# EAGLE design pcb_kamex_fuentes_5v_7amp (EAGLE 7.6.0)
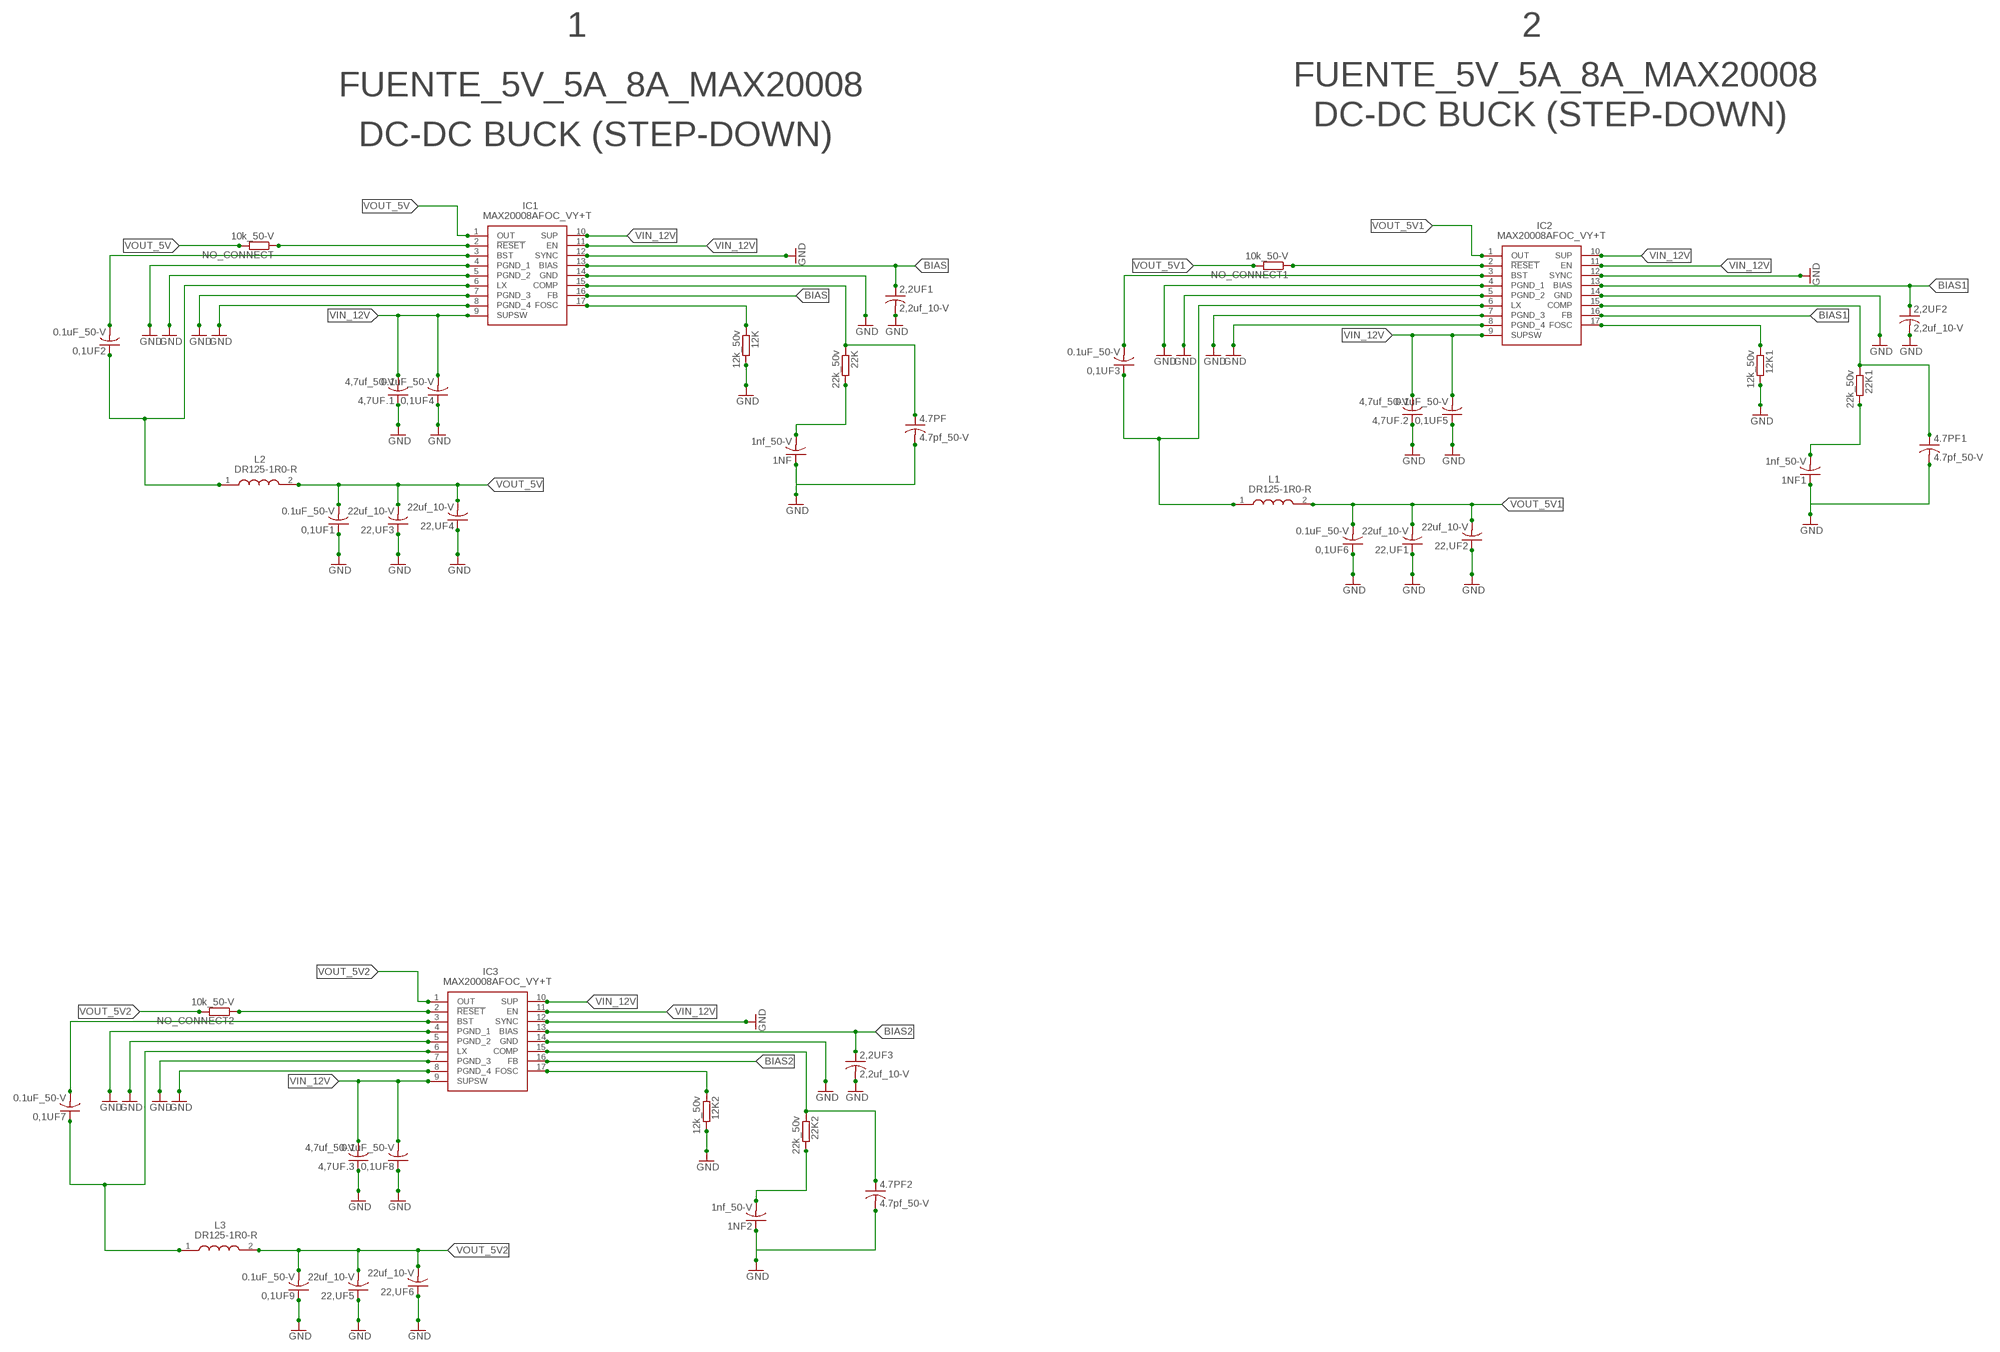
[diagram p0: schematic, sheet 1]

## Parts
0,1UF1  0.1uF_50-V  C-USC0805  [C0805]
0,1UF2  0.1uF_50-V  C-USC0805  [C0805]
0,1UF3  0.1uF_50-V  C-USC0805  [C0805]
0,1UF4  0.1uF_50-V  C-USC0805  [C0805]
0,1UF5  0.1uF_50-V  C-USC0805  [C0805]
0,1UF6  0.1uF_50-V  C-USC0805  [C0805]
0,1UF7  0.1uF_50-V  C-USC0805  [C0805]
0,1UF8  0.1uF_50-V  C-USC0805  [C0805]
0,1UF9  0.1uF_50-V  C-USC0805  [C0805]
1NF  1nf_50-V  C-USC0805  [C0805]
1NF1  1nf_50-V  C-USC0805  [C0805]
1NF2  1nf_50-V  C-USC0805  [C0805]
2,2UF1  2,2uf_10-V  C-USC0805  [C0805]
2,2UF2  2,2uf_10-V  C-USC0805  [C0805]
2,2UF3  2,2uf_10-V  C-USC0805  [C0805]
4,7UF.1  4,7uf_50-V  C-USC0805  [C0805]
4,7UF.2  4,7uf_50-V  C-USC0805  [C0805]
4,7UF.3  4,7uf_50-V  C-USC0805  [C0805]
4.7PF  4.7pf_50-V  C-USC0805  [C0805]
4.7PF1  4.7pf_50-V  C-USC0805  [C0805]
4.7PF2  4.7pf_50-V  C-USC0805  [C0805]
12K  12k_50v  R-EU_M0805  [M0805]
12K1  12k_50v  R-EU_M0805  [M0805]
12K2  12k_50v  R-EU_M0805  [M0805]
22,UF1  22uf_10-V  C-USC0805  [C0805]
22,UF2  22uf_10-V  C-USC0805  [C0805]
22,UF3  22uf_10-V  C-USC0805  [C0805]
22,UF4  22uf_10-V  C-USC0805  [C0805]
22,UF5  22uf_10-V  C-USC0805  [C0805]
22,UF6  22uf_10-V  C-USC0805  [C0805]
22K  22k_50v  R-EU_M0805  [M0805]
22K1  22k_50v  R-EU_M0805  [M0805]
22K2  22k_50v  R-EU_M0805  [M0805]
IC1  MAX20008AFOC_VY+T  [MAX20008AFOCVYT]
IC2  MAX20008AFOC_VY+T  [MAX20008AFOCVYT]
IC3  MAX20008AFOC_VY+T  [MAX20008AFOCVYT]
L1  DR125-1R0-R  [INDPM125125X600N]
L2  DR125-1R0-R  [INDPM125125X600N]
L3  DR125-1R0-R  [INDPM125125X600N]
NO_CONNECT  10k_50-V  R-EU_M0805  [M0805]
NO_CONNECT1  10k_50-V  R-EU_M0805  [M0805]
NO_CONNECT2  10k_50-V  R-EU_M0805  [M0805]

## Nets
BIAS: 2,2UF1.1 IC1.13(BIAS) IC1.16(FB)
BIAS1: 2,2UF2.1 IC2.13(BIAS) IC2.16(FB)
BIAS2: 2,2UF3.1 IC3.13(BIAS) IC3.16(FB)
BST: 0,1UF2.2 IC1.3(BST)
BST1: 0,1UF3.2 IC2.3(BST)
BST2: 0,1UF7.2 IC3.3(BST)
COM: 4.7PF.1 22K.1 IC1.15(COMP)
COM1: 4.7PF1.1 22K1.1 IC2.15(COMP)
COM2: 4.7PF2.1 22K2.1 IC3.15(COMP)
GND [power]: 0,1UF1.1 0,1UF4.1 0,1UF5.1 0,1UF6.1 0,1UF8.1 0,1UF9.1 1NF1.1 1NF2.1 1NF.1 2,2UF1.2 2,2UF2.2 2,2UF3.2 4,7UF.1.1 4,7UF.2.1 4,7UF.3.1 4.7PF1.2 4.7PF2.2 4.7PF.2 12K1.2 12K2.2 12K.2 22,UF1.1 22,UF2.1 22,UF3.1 22,UF4.1 22,UF5.1 22,UF6.1 IC1.4(PGND_1) IC1.5(PGND_2) IC1.7(PGND_3) IC1.8(PGND_4) IC1.12(SYNC) IC1.14(GND) IC2.4(PGND_1) IC2.5(PGND_2) IC2.7(PGND_3) IC2.8(PGND_4) IC2.12(SYNC) IC2.14(GND) IC3.4(PGND_1) IC3.5(PGND_2) IC3.7(PGND_3) IC3.8(PGND_4) IC3.12(SYNC) IC3.14(GND)
N$1: 12K1.1 IC2.17(FOSC)
N$2: 1NF.2 22K.2
N$4: 0,1UF3.1 IC2.6(LX) L1.1
N$5: IC2.2(!RESET) NO_CONNECT1.1
N$6: 1NF1.2 22K1.2
N$7: 12K.1 IC1.17(FOSC)
N$9: 12K2.1 IC3.17(FOSC)
N$10: 0,1UF7.1 IC3.6(LX) L3.1
N$11: 0,1UF2.1 IC1.6(LX) L2.1
N$12: IC1.2(!RESET) NO_CONNECT.1
N$13: IC3.2(!RESET) NO_CONNECT2.1
N$14: 1NF2.2 22K2.2
VIN_12V [power]: 0,1UF4.2 0,1UF5.2 0,1UF8.2 4,7UF.1.2 4,7UF.2.2 4,7UF.3.2 IC1.9(SUPSW) IC1.10(SUP) IC1.11(EN) IC2.9(SUPSW) IC2.10(SUP) IC2.11(EN) IC3.9(SUPSW) IC3.10(SUP) IC3.11(EN)
VOUT_5V: 0,1UF1.2 22,UF3.2 22,UF4.2 IC1.1(OUT) L2.2 NO_CONNECT.2
VOUT_5V1: 0,1UF6.2 22,UF1.2 22,UF2.2 IC2.1(OUT) L1.2 NO_CONNECT1.2
VOUT_5V2: 0,1UF9.2 22,UF5.2 22,UF6.2 IC3.1(OUT) L3.2 NO_CONNECT2.2

## Notes on the sheet
- 1 | 2
- FUENTE_5V_5A_8A_MAX20008 | FUENTE_5V_5A_8A_MAX20008
- DC-DC BUCK (STEP-DOWN)
- DC-DC BUCK (STEP-DOWN)

## Library data of the parts
0,1UF1-0,1UF9 1NF 1NF1 1NF2 2,2UF1-2,2UF3 4,7UF.1-4,7UF.3 4.7PF 4.7PF1 4.7PF2 22,UF1-22,UF6 = rcl:C-US: CAPACITOR, American symbol
12K 12K1 12K2 22K 22K1 22K2 NO_CONNECT NO_CONNECT1 NO_CONNECT2 = rcl_dani:R-EU_: RESISTOR, European symbol
IC1-IC3 = MAX20008AFOC_VY+T:MAX20008AFOC_VY+T: Switching Voltage Regulators 36V, 220kHz to 2.2MHz, 4A/6A/8A Fully integrated step down converter Source: Datasheet <https://componentsearchengine.com//MAX20008AFOC_VY T.pdf>; DESCRIPTION: Switching Voltage Regulators 36V, 220kHz to 2.2MHz, 4A/6A/8A Fully integrated step down converter; HEIGHT: 0.75mm; MANUFACTURER_NAME: Analog Devices; MANUFACTURER_PART_NUMBER: MAX20008AFOC/VY+T; MOUSER_PART_NUMBER: 700-MAX20008AFOC/VYT; MOUSER_PRICE-STOCK: https://www.mouser.co.uk/ProductDetail/Analog-Devices-Maxim-Integrated/MAX20008AFOC-VY%2bT?qs=vLWxofP3U2wvQQR8GkDmgw%3D%3D
L1-L3 = DR125-1R0-R:DR125-1R0-R: Inductor Power Shielded Drum Core 0.894uH/1uH 20% 100KHz Ferrite 15A 0.0024Ohm DCR T/R Source: Datasheet <https://www.eaton.com/content/dam/eaton/products/electronic-components/resources/data-sheet/eaton-dr-high-power-density-high-efficiency-shielded-drum-core-power-inductors-data-sheet.pdf>; DESCRIPTION: Inductor Power Shielded Drum Core 0.894uH/1uH 20% 100KHz Ferrite 15A 0.0024Ohm DCR T/R; HEIGHT: 6mm; MANUFACTURER_NAME: Eaton; MANUFACTURER_PART_NUMBER: DR125-1R0-R

## Net classes
0 default: width 0.381 mm, drill 0.01 mm, clearance 0.254 mm
1 power: width 1.27 mm, drill 0.762 mm, clearance 0.254 mm
2 thin: width 0.254 mm, drill 0.254 mm, clearance 0.254 mm

## Board
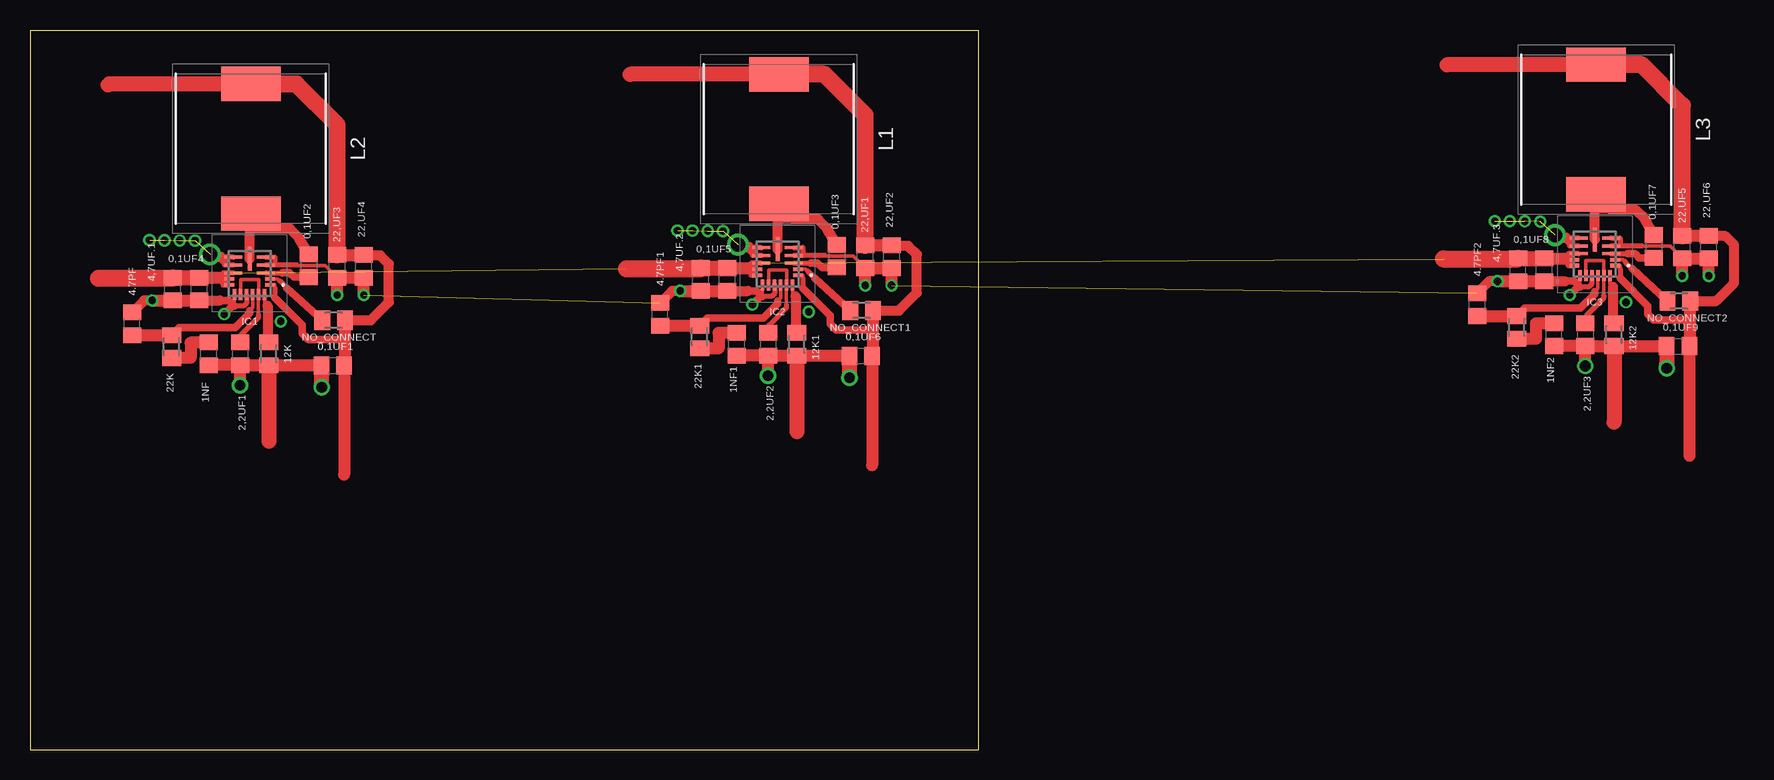
[diagram p1: board, top side]
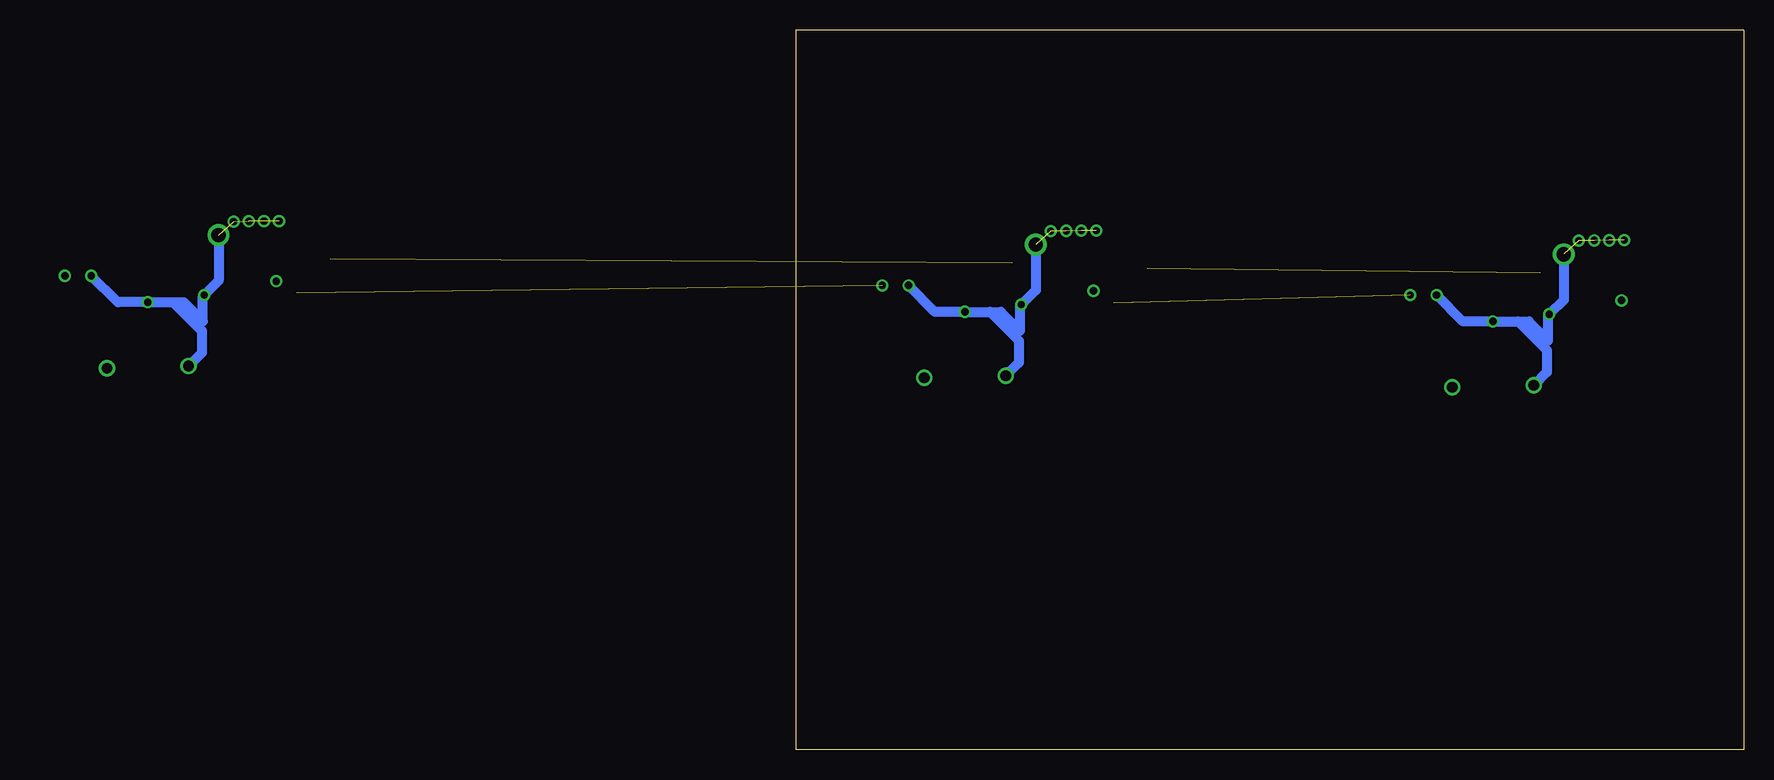
[diagram p2: board, bottom side, seen from below]

Size 79 x 60 mm. Coordinates in mm from the lower left corner, seen from the top.
Outline: 0,0 79,0 79,60 0,60 0,0
Copper layers (1*16): Top 0.035mm / dielectric 1.5mm / Bottom 0.035mm
Design rules "default *": minimum track width 10mil, minimum drill 24mil, track to track 8mil, track to pad 8mil, pad to pad 8mil, via to via 8mil, smd to smd 8mil, copper to edge 10mil, drill to drill 8mil, minimum pad ring 10mil, minimum via ring 8mil, stop-mask expansion 4mil, vias tented up to drill 0mil, thermal gap 10mil
Holes 3.2 mm at -98.9,24.6 -101,47.8

### Footprints (pad centres in the part's own frame; a part is rotated, then mirrored left to right if it is on the bottom)
C0805 = smd 1.3 x 1.5: 1 -0.95,0; 2 0.95,0
M0805 = smd 1.3 x 1.6: 1 -0.95,0; 2 0.95,0
MAX20008AFOCVYT = smd 0.8 x 0.3: 1 -1.7,0.948; 2 -1.7,0.45; 10 1.7,0.45; 11 1.7,0.948 | smd 1.5 x 0.25: 3 -1.35,-0.05; 4 -1.35,-0.7; 5 -1.35,-1.35; 7 1.35,-1.35; 8 1.35,-0.7; 9 1.35,-0.05 | smd 0.35 x 2: 6 0,-1.225 | smd 0.3 x 0.925: 12 1.25,1.763; 13 0.75,1.763; 14 0.25,1.763; 15 -0.25,1.763; 16 -0.75,1.763; 17 -1.25,1.763
INDPM125125X600N = smd 2.85 x 4.95: 1 -5.4,0; 2 5.4,0

### Placement (x,y rotation side)
0,1UF1  25.23,32.03 0 top
0,1UF2  23.22,40.35 270 top
0,1UF3  67.22,41.15 270 top
0,1UF4  14.1,38.4 90 top
0,1UF5  58.1,39.2 90 top
0,1UF6  69.23,32.83 0 top
0,1UF7  135.32,41.95 270 top  (outside the outline)
0,1UF8  126.2,40 90 top  (outside the outline)
0,1UF9  137.33,33.63 0 top  (outside the outline)
1NF  14.9,33 90 top
1NF1  58.9,33.8 90 top
1NF2  127,34.6 90 top  (outside the outline)
2,2UF1  17.5,33 270 top
2,2UF2  61.5,33.8 270 top
2,2UF3  129.6,34.6 270 top  (outside the outline)
4,7UF.1  11.9,38.4 90 top
4,7UF.2  55.9,39.2 90 top
4,7UF.3  124,40 90 top  (outside the outline)
4.7PF  8.5,35.5 90 top
4.7PF1  52.5,36.3 90 top
4.7PF2  120.6,37.1 90 top  (outside the outline)
12K  19.9,33 270 top
12K1  63.9,33.8 270 top
12K2  132,34.6 270 top  (outside the outline)
22,UF1  69.6,41.1 90 top
22,UF2  71.8,41.1 90 top
22,UF3  25.6,40.3 90 top
22,UF4  27.8,40.3 90 top
22,UF5  137.7,41.9 90 top  (outside the outline)
22,UF6  139.9,41.9 90 top  (outside the outline)
22K  11.8,33.6 270 top
22K1  55.8,34.4 270 top
22K2  123.9,35.2 270 top  (outside the outline)
IC1  18.3,39.7 180 top
IC2  62.3,40.5 180 top
IC3  130.4,41.3 180 top  (outside the outline)
L1  62.4,50.9 90 top
L2  18.4,50.1 90 top
L3  130.5,51.7 90 top  (outside the outline)
NO_CONNECT  25.3,35.8 0 top
NO_CONNECT1  69.3,36.6 0 top
NO_CONNECT2  137.4,37.4 0 top  (outside the outline)

### Tracks (layer width: path | path; a pad name or v marks a point on that pad's centre or on a via)
BIAS
  Top 0.305: IC1.13 17.55,39.19 19.06,39.19 IC1.16 19.04,37.93 19.04,36.29 | 2,2UF1.1 17.5,34
  Top 0.406: 19.04,36.29 19.04,36.04 17.6,34.6 17.6,34.05 2,2UF1.1
BIAS1
  Top 0.305: IC2.13 61.55,39.99 63.06,39.99 IC2.16 63.04,38.73 63.04,37.09 | 2,2UF2.1 61.5,34.8
  Top 0.406: 63.04,37.09 63.04,36.84 61.6,35.4 61.6,34.85 2,2UF2.1
BIAS2
  Top 0.305: IC3.13 129.65,40.79 131.16,40.79 IC3.16 131.14,39.53 131.14,37.89 | 2,2UF3.1 129.6,35.6
  Top 0.406: 131.14,37.89 131.14,37.64 129.7,36.2 129.7,35.65 2,2UF3.1
BST
  Top 0.406: IC1.3 21.05,39.75
  Top 0.61: 0,1UF2.2 22,39.4 21.7,39.7 21.68,39.7 21.62,39.76 21.06,39.76 21.05,39.75
BST1
  Top 0.406: IC2.3 65.05,40.55
  Top 0.61: 0,1UF3.2 66,40.2 65.7,40.5 65.68,40.5 65.62,40.56 65.06,40.56 65.05,40.55
BST2
  Top 0.406: IC3.3 133.15,41.35
  Top 0.61: 0,1UF7.2 134.1,41 133.8,41.3 133.78,41.3 133.72,41.36 133.16,41.36 133.15,41.35
COM
  Top 0.305: IC1.15 18.55,36.85 18.3,36.6
  Top 0.61: 18.3,36.6 18.3,36.4 17.1,35.2 12.45,35.2 22K.1
  Top 1.016: 4.7PF.1 22K.1
COM1
  Top 0.305: IC2.15 62.55,37.65 62.3,37.4
  Top 0.61: 62.3,37.4 62.3,37.2 61.1,36 56.45,36 22K1.1
  Top 1.016: 4.7PF1.1 22K1.1
COM2
  Top 0.305: IC3.15 130.65,38.45 130.4,38.2
  Top 0.61: 130.4,38.2 130.4,38 129.2,36.8 124.55,36.8 22K2.1
  Top 1.016: 4.7PF2.1 22K2.1
GND  (via drill 0.6, 0.9, 1.2)  (14 unrouted)
  Top 0.305: 22.24,40.4 22.28,40.36 24.59,40.36 22,UF3.1 | IC1.12 17.04,37.93 17.04,36.98 17.03,36.97 | 66.24,41.2 66.28,41.16 68.59,41.16 22,UF1.1 | IC2.12 61.04,38.73 61.04,37.78 61.03,37.77 | 134.34,42 134.38,41.96 136.69,41.96 22,UF5.1 | IC3.12 129.14,39.53 129.14,38.58 129.13,38.57
  Top 0.406: IC1.7 16.2,41.05 | 16.2,41.05 16.2,40.8 16.2,40.4 IC1.8 | IC1.5 20.42,41.05 20.42,41.06 20.41,41.06 20.41,40.4 | 20.41,40.4 IC1.4 | 16.2,41.05 16.2,41.1 | IC1.14 18.05,37.23 17.8,36.98 17.04,36.98 | 22.24,40.4 20.41,40.4 | IC2.7 60.2,41.85 | 60.2,41.85 60.2,41.6 60.2,41.2 IC2.8 | IC2.5 64.42,41.85 64.42,41.86 64.41,41.86 64.41,41.2 | 64.41,41.2 IC2.4 | 60.2,41.85 60.2,41.9 | IC2.14 62.05,38.03 61.8,37.78 61.04,37.78 | 66.24,41.2 64.41,41.2 | IC3.7 128.3,42.65 | 128.3,42.65 128.3,42.4 128.3,42 IC3.8 | IC3.5 132.52,42.65 132.52,42.66 132.51,42.66 132.51,42 | 132.51,42 IC3.4 | 128.3,42.65 128.3,42.7 | IC3.14 130.15,38.83 129.9,38.58 129.14,38.58 | 134.34,42 132.51,42
  Top 0.61: 15.83,37.45 16.57,37.45 17.04,36.98 | 17.03,36.97 16.87,36.97 v16.2,36.3 | 59.83,38.25 60.57,38.25 61.04,37.78 | 61.03,37.77 60.87,37.77 v60.2,37.1 | 127.93,39.05 128.67,39.05 129.14,38.58 | 129.13,38.57 128.97,38.57 v128.3,37.9
  Top 0.813: 0,1UF4.1 15.83,37.45 | 16.2,40.8 15.9,41.1 15.2,41.1 v15,41.3 | v10.19,37.45 9.5,37.45 4.7PF.2 | 0,1UF5.1 59.83,38.25 | 60.2,41.6 59.9,41.9 59.2,41.9 v59,42.1 | v54.19,38.25 53.5,38.25 4.7PF1.2 | 0,1UF8.1 127.93,39.05 | 128.3,42.4 128,42.7 127.3,42.7 v127.1,42.9 | v122.29,39.05 121.6,39.05 4.7PF2.2
  Top 1.016: 0,1UF4.1 4,7UF.1.1 v10.19,37.45 | 2,2UF1.2 1NF.1 | v25.6,37.9 22,UF3.1 22,UF4.1 v27.8,37.9 | 2,2UF1.2 12K.2 24.26,32.05 0,1UF1.1 | v17.5,30.37 2,2UF1.2 | 0,1UF5.1 4,7UF.2.1 v54.19,38.25 | 2,2UF2.2 1NF1.1 | v69.6,38.7 22,UF1.1 22,UF2.1 v71.8,38.7 | 2,2UF2.2 12K1.2 68.26,32.85 0,1UF6.1 | v61.5,31.17 2,2UF2.2 | 0,1UF8.1 4,7UF.3.1 v122.29,39.05 | 2,2UF3.2 1NF2.1 | v137.7,39.5 22,UF5.1 22,UF6.1 v139.9,39.5 | 2,2UF3.2 12K2.2 136.36,33.65 0,1UF9.1 | v129.6,31.97 2,2UF3.2
  Top 1.27: 12K.2 19.9,25.7 | 0,1UF1.1 24.28,30.52 v24.3,30.2 | 12K1.2 63.9,26.5 | 0,1UF6.1 68.28,31.32 v68.3,31 | 12K2.2 132,27.3 | 0,1UF9.1 136.38,32.12 v136.4,31.8
  Bottom 0.813: v15,41.3 15,37.5 v16.2,36.3 16.3,36.2 16.3,34.1 17.9,35.7 18.8,35.7 | 18.8,35.7 v20.9,35.7 23.4,35.7 v25.6,37.9 | 18.8,35.7 16.4,33.3 16.4,31.47 v17.5,30.37 | v59,42.1 59,38.3 v60.2,37.1 60.3,37 60.3,34.9 61.9,36.5 62.8,36.5 | 62.8,36.5 v64.9,36.5 67.4,36.5 v69.6,38.7 | 62.8,36.5 60.4,34.1 60.4,32.27 v61.5,31.17 | v127.1,42.9 127.1,39.1 v128.3,37.9 128.4,37.8 128.4,35.7 130,37.3 130.9,37.3 | 130.9,37.3 v133,37.3 135.5,37.3 v137.7,39.5 | 130.9,37.3 128.5,34.9 128.5,33.07 v129.6,31.97
  other vias: 11.21,42.46 12.47,42.45 13.75,42.43 9.96,42.47 55.21,43.26 56.47,43.25 57.75,43.23 53.96,43.27 123.31,44.06 124.57,44.05 125.85,44.03 122.06,44.07
  cutout Bottom: 17.6,43.8 17.6,41.39 17.86,41.39 17.86,39.79 18.72,39.79 18.72,41.4 21,41.4 21,40.8 22.2,40.8 22.2,42 22,42.3 21.95,42.39 21.91,42.46 21.7,42.8 19,42.8 19,43.8
  cutout Bottom: 61.6,44.6 61.6,42.19 61.86,42.19 61.86,40.59 62.72,40.59 62.72,42.2 65,42.2 65,41.6 66.2,41.6 66.2,42.8 66,43.1 65.95,43.19 65.91,43.26 65.7,43.6 63,43.6 63,44.6
  cutout Bottom: 129.7,45.4 129.7,42.99 129.96,42.99 129.96,41.39 130.82,41.39 130.82,43 133.1,43 133.1,42.4 134.3,42.4 134.3,43.6 134.1,43.9 134.05,43.99 134.01,44.06 133.8,44.4 131.1,44.4 131.1,45.4
N$1
  Top 0.305: 63.55,35.1 12K1.1 | IC2.17 63.55,38.05 63.8,37.8
  Top 0.813: 63.8,37.8 63.8,34.85 12K1.1
N$2
  Top 1.016: 1NF.2 14.9,33.93 13.39,33.93 13.39,32.65 22K.2
N$3
  cutout Top (isolate 0.2, rank 2): 17.86,39.79 18.72,39.79 18.72,41.4 21,41.4 21,40.8 22.2,40.8 22.2,42 21.7,42.8 19,42.8 19,43.1 21.1,43.1 21.1,46.4 15.7,46.4 15.7,43.1 17.6,43.1 17.6,41.38 17.86,41.38
N$4
  Top 0.813: IC2.6 62.3,44.3 65.7,44.2 66.4,43.5 0,1UF3.1
  Top 1.016: 62.3,44.3 62.3,45.4 L1.1
N$5
  Top 0.305: 67.93,37.02 NO_CONNECT1.1 | IC2.2 64.65,40.05 64.8,39.9
  Top 0.406: 64.8,39.9 65.4,39.3
  Top 0.61: 65.4,39.3 NO_CONNECT1.1
N$6
  Top 1.016: 1NF1.2 58.9,34.73 57.39,34.73 57.39,33.45 22K1.2
N$7
  Top 0.305: 19.55,34.3 12K.1 | IC1.17 19.55,37.25 19.8,37
  Top 0.813: 19.8,37 19.8,34.05 12K.1
N$8
  cutout Top (isolate 0.2, rank 2): 61.86,40.59 62.72,40.59 62.72,42.2 65,42.2 65,41.6 66.2,41.6 66.2,42.8 65.7,43.6 63,43.6 63,43.9 65.1,43.9 65.1,47.2 59.7,47.2 59.7,43.9 61.6,43.9 61.6,42.18 61.86,42.18
N$9
  Top 0.305: 131.65,35.9 12K2.1 | IC3.17 131.65,38.85 131.9,38.6
  Top 0.813: 131.9,38.6 131.9,35.65 12K2.1
N$10
  Top 0.813: IC3.6 130.4,45.1 133.8,45 134.5,44.3 0,1UF7.1
  Top 1.016: 130.4,45.1 130.4,46.2 L3.1
N$11
  Top 0.813: IC1.6 18.3,43.5 21.7,43.4 22.4,42.7 0,1UF2.1
  Top 1.016: 18.3,43.5 18.3,44.6 L2.1
N$12
  Top 0.305: 23.93,36.22 NO_CONNECT.1 | IC1.2 20.65,39.25 20.8,39.1
  Top 0.406: 20.8,39.1 21.4,38.5
  Top 0.61: 21.4,38.5 NO_CONNECT.1
N$13
  Top 0.305: 136.03,37.82 NO_CONNECT2.1 | IC3.2 132.75,40.85 132.9,40.7
  Top 0.406: 132.9,40.7 133.5,40.1
  Top 0.61: 133.5,40.1 NO_CONNECT2.1
N$14
  Top 1.016: 1NF2.2 127,35.53 125.49,35.53 125.49,34.25 22K2.2
N$15
  cutout Top (isolate 0.2, rank 2): 129.96,41.39 130.82,41.39 130.82,43 133.1,43 133.1,42.4 134.3,42.4 134.3,43.6 133.8,44.4 131.1,44.4 131.1,44.7 133.2,44.7 133.2,48 127.8,48 127.8,44.7 129.7,44.7 129.7,42.98 129.96,42.98
VIN_12V  (2 unrouted)
  Top 0.406: IC1.9 16.07,39.75 16.07,39.3 16.07,39.2 | 16.07,39.2 16.07,38.77 16.09,38.75 IC1.11 | IC1.10 16.12,39.25 16.07,39.2 | IC2.9 60.07,40.55 60.07,40.1 60.07,40 | 60.07,40 60.07,39.57 60.09,39.55 IC2.11 | IC2.10 60.12,40.05 60.07,40 | IC3.9 128.17,41.35 128.17,40.9 128.17,40.8 | 128.17,40.8 128.17,40.37 128.19,40.35 IC3.11 | IC3.10 128.22,40.85 128.17,40.8
  Top 1.016: 0,1UF4.2 16.02,39.35 16.07,39.3 | 0,1UF5.2 60.02,40.15 60.07,40.1 | 0,1UF8.2 128.12,40.95 128.17,40.9
  Top 1.27: 4,7UF.1.2 0,1UF4.2 | 4,7UF.2.2 0,1UF5.2 | 4,7UF.3.2 0,1UF8.2
  Top 1.422: 5.7,39.3 11.85,39.3 4,7UF.1.2 | 49.7,40.1 55.85,40.1 4,7UF.2.2 | 117.8,40.9 123.95,40.9 4,7UF.3.2
VOUT_5V
  Top 0.305: 22,UF4.2 | 0,1UF1.2 26.25,32 | IC1.1 20.4,38.75 20.4,38.5
  Top 0.406: 20.4,38.5 20.4,37.7
  Top 0.61: 20.4,37.7 22.7,35.4 22.7,34.7 23.2,34.2 26.25,34.2
  Top 0.813: NO_CONNECT.2 28.4,35.8 29.9,37.3 29.9,40.5 29.2,41.2 27.85,41.2 22,UF4.2
  Top 1.016: 22,UF3.2 22,UF4.2 | 0,1UF1.2 26.18,22.92 | 26.25,32 26.25,34.2 NO_CONNECT.2
  Top 1.27: L2.2 6.6,55.5 6.5,55.4
  Top 1.422: 22,UF3.2 25.6,52.1 22.2,55.5 L2.2
VOUT_5V1
  Top 0.305: 22,UF2.2 | 0,1UF6.2 70.25,32.8 | IC2.1 64.4,39.55 64.4,39.3
  Top 0.406: 64.4,39.3 64.4,38.5
  Top 0.61: 64.4,38.5 66.7,36.2 66.7,35.5 67.2,35 70.25,35
  Top 0.813: NO_CONNECT1.2 72.4,36.6 73.9,38.1 73.9,41.3 73.2,42 71.85,42 22,UF2.2
  Top 1.016: 22,UF1.2 22,UF2.2 | 0,1UF6.2 70.18,23.72 | 70.25,32.8 70.25,35 NO_CONNECT1.2
  Top 1.27: L1.2 50,56.3
  Top 1.422: 22,UF1.2 69.6,52.9 66.2,56.3 L1.2
VOUT_5V2
  Top 0.305: 22,UF6.2 | 0,1UF9.2 138.35,33.6 | IC3.1 132.5,40.35 132.5,40.1
  Top 0.406: 132.5,40.1 132.5,39.3
  Top 0.61: 132.5,39.3 134.8,37 134.8,36.3 135.3,35.8 138.35,35.8
  Top 0.813: NO_CONNECT2.2 140.5,37.4 142,38.9 142,42.1 141.3,42.8 139.95,42.8 22,UF6.2
  Top 1.016: 22,UF5.2 22,UF6.2 | 0,1UF9.2 138.28,24.52 | 138.35,33.6 138.35,35.8 NO_CONNECT2.2
  Top 1.27: L3.2 118.1,57.1
  Top 1.422: 22,UF5.2 137.7,53.7 134.3,57.1 L3.2